# Altium schematic sheet 3MotorDrivers.SchDoc
size A4; SheetNumber: 1; SheetTotal: 1
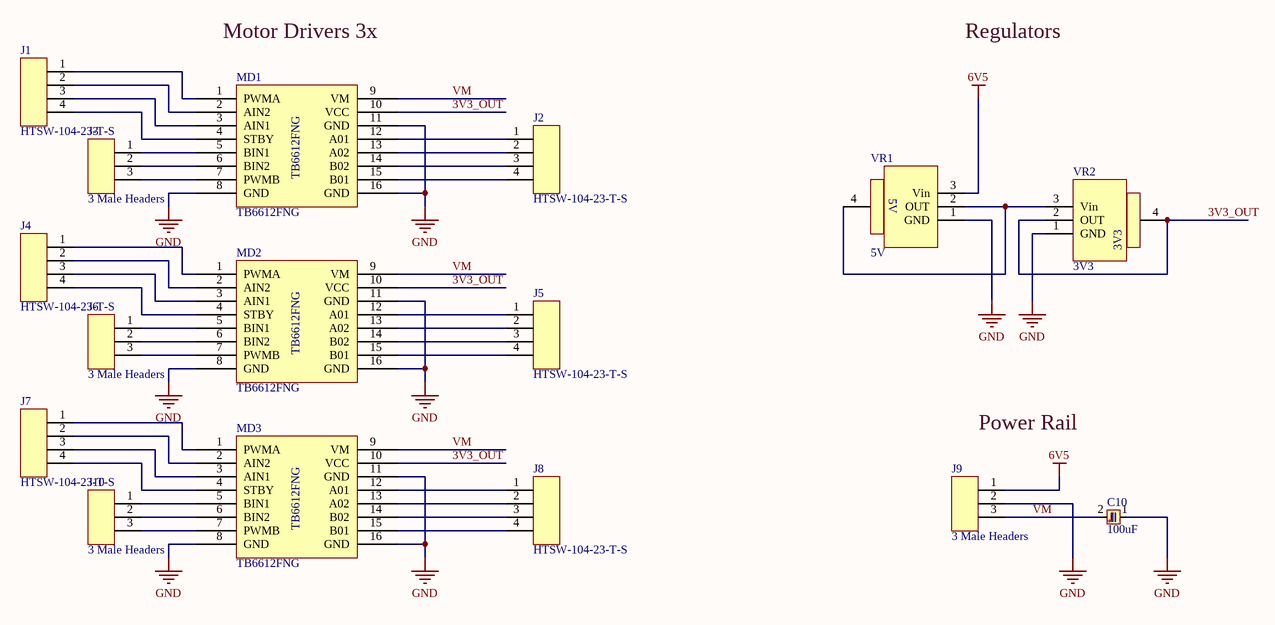
[diagram p0: 3MotorDrivers.SchDoc]

## Parts
C10  100uF  [47nF]
J1  HTSW-104-23-T-S  [4 POS]
J2  HTSW-104-23-T-S  [4 POS]
J3  3 Male Headers  [3 POS]
J4  HTSW-104-23-T-S  [4 POS]
J5  HTSW-104-23-T-S  [4 POS]
J6  3 Male Headers  [3 POS]
J7  HTSW-104-23-T-S  [4 POS]
J8  HTSW-104-23-T-S  [4 POS]
J9  3 Male Headers  [3 POS]
J10  3 Male Headers  [3 POS]
MD1  TB6612FNG  [TB6612FNG]
MD2  TB6612FNG  [TB6612FNG]
MD3  TB6612FNG  [TB6612FNG]
VR1  5V  [3V3]
VR2  3V3  [3V3]

## Nets
6V5: J9.1(SIG) VR1.3(Vin)
GND: C10.1 J9.2(VCC) MD1.8(GND) MD1.11(GND) MD1.16(GND) MD2.8(GND) MD2.11(GND) MD2.16(GND) MD3.8(GND) MD3.11(GND) MD3.16(GND) VR1.1(GND) VR2.1(GND)
3V3_OUT: MD1.10(VCC) MD2.10(VCC) MD3.10(VCC) VR2.2(OUT) VR2.4(OUT)
VM: C10.2 J9.3(GND) MD1.9(VM) MD2.9(VM) MD3.9(VM)
NetJ1_1: J1.1(VM) MD1.1(PWMA)
NetJ1_2: J1.2(GND) MD1.2(AIN2)
NetJ1_3: J1.3(SCL) MD1.3(AIN1)
NetJ1_4: J1.4(SDA) MD1.4(STBY)
NetJ2_1: J2.1(VM) MD1.12(A01)
NetJ2_2: J2.2(GND) MD1.13(A02)
NetJ2_3: J2.3(SCL) MD1.14(B02)
NetJ2_4: J2.4(SDA) MD1.15(B01)
NetJ3_1: J3.1(SIG) MD1.5(BIN1)
NetJ3_2: J3.2(VCC) MD1.6(BIN2)
NetJ3_3: J3.3(GND) MD1.7(PWMB)
NetJ4_1: J4.1(VM) MD2.1(PWMA)
NetJ4_2: J4.2(GND) MD2.2(AIN2)
NetJ4_3: J4.3(SCL) MD2.3(AIN1)
NetJ4_4: J4.4(SDA) MD2.4(STBY)
NetJ5_1: J5.1(VM) MD2.12(A01)
NetJ5_2: J5.2(GND) MD2.13(A02)
NetJ5_3: J5.3(SCL) MD2.14(B02)
NetJ5_4: J5.4(SDA) MD2.15(B01)
NetJ6_1: J6.1(SIG) MD2.5(BIN1)
NetJ6_2: J6.2(VCC) MD2.6(BIN2)
NetJ6_3: J6.3(GND) MD2.7(PWMB)
NetJ7_1: J7.1(VM) MD3.1(PWMA)
NetJ7_2: J7.2(GND) MD3.2(AIN2)
NetJ7_3: J7.3(SCL) MD3.3(AIN1)
NetJ7_4: J7.4(SDA) MD3.4(STBY)
NetJ8_1: J8.1(VM) MD3.12(A01)
NetJ8_2: J8.2(GND) MD3.13(A02)
NetJ8_3: J8.3(SCL) MD3.14(B02)
NetJ8_4: J8.4(SDA) MD3.15(B01)
NetJ10_1: J10.1(SIG) MD3.5(BIN1)
NetJ10_2: J10.2(VCC) MD3.6(BIN2)
NetJ10_3: J10.3(GND) MD3.7(PWMB)
NetVR1_2: VR1.2(OUT) VR1.4(OUT) VR2.3(Vin)

## Notes on the sheet
- Motor Drivers 3x
- Regulators
- Power Rail

## Library data of the parts
C10 = 100uF: Pin Header, Board-to-Board, Wire-to-Board, 2.54 mm, 1 Rows, 2 Contacts, Through Hole, HTSW Series; Manufacturer: Samtec; Manufacturer Part Number: HTSW-102-16-T-S; Manufacturer Lifecycle Status: PRODUCTION; Gender: Male; Number of Contacts: 2; Pitch: 2.54mm; Supplier: Avnet; Supplier Part Number: HTSW-102-16-T-S; RoHS: Compliant; Category: Board to Board Connectors; Stock: 2347; Pricing: 1=0.1485, 1000=0.06895, 5000=0.0494, 10000=0.0491, 20000=0.04881 (USD); Contact Material: Bronze; Contact Plating: Tin; Lead Pitch: 2.54mm; Lifecycle Status: Production; Mounting Technology: Through Hole; Number of Rows: 1; Packaging: Bulk; Radiation Hardening: No; REACH SVHC: No; Termination: Solder; ComponentLink1URL: https://datasheet.octopart.com:443/HTSW-102-16-T-S-Samtec-datasheet-97084101.pdf?src-supplier=Samtec; ComponentLink1Description: https://datasheet.octopart.com:443/HTSW-102-16-T-S-Samtec-datasheet-97084101.pdf?src-supplier=Samtec; ComponentLink2URL: https://sigma.octopart.com:443/14433675/technical_drawing/Samtec-HTSW-102-16-T-S.pdf?src-supplier=Samtec; ComponentLink2Description: https://sigma.octopart.com:443/14433675/technical_drawing/Samtec-HTSW-102-16-T-S.pdf?src-supplier=Samtec; ComponentLink3URL: https://datasheet.octopart.com:443/HTSW-102-16-T-S-Samtec-datasheet-150856372.pdf?src-supplier=Sager+Electronics; ComponentLink3Description: https://datasheet.octopart.com:443/HTSW-102-16-T-S-Samtec-datasheet-150856372.pdf?src-supplier=Sager+Electronics; ComponentLink4URL: https://datasheet.octopart.com:443/HTSW-102-16-T-S-Samtec-datasheet-151455181.pdf?src-supplier=Sager+Electronics; ComponentLink4Description: https://datasheet.octopart.com:443/HTSW-102-16-T-S-Samtec-datasheet-151455181.pdf?src-supplier=Sager+Electronics; ComponentLink5URL: https://datasheet.octopart.com:443/HTSW-102-16-T-S-Samtec-datasheet-136646178.pdf?src-supplier=Electro+Sonic; ComponentLink5Description: https://datasheet.octopart.com:443/HTSW-102-16-T-S-Samtec-datasheet-136646178.pdf?src-supplier=Electro+Sonic; ComponentLink6URL: https://datasheet.octopart.com:443/HTSW-102-16-T-S-Samtec-datasheet-62107121.pdf?src-supplier=Farnell; ComponentLink6Description: https://datasheet.octopart.com:443/HTSW-102-16-T-S-Samtec-datasheet-62107121.pdf?src-supplier=Farnell; ComponentLink7URL: https://datasheet.octopart.com:443/HTSW-102-16-T-S-Samtec-datasheet-180249195.pdf?src-supplier=JRH+Electronics; ComponentLink7Description: https://datasheet.octopart.com:443/HTSW-102-16-T-S-Samtec-datasheet-180249195.pdf?src-supplier=JRH+Electronics; ComponentLink8URL: https://datasheet.octopart.com/HTSW-102-16-T-S-Samtec-datasheet-86818365.pdf; ComponentLink8Description: https://datasheet.octopart.com/HTSW-102-16-T-S-Samtec-datasheet-86818365.pdf; ComponentLink9URL: https://datasheet.octopart.com:443/HTSW-102-16-T-S-Samtec-datasheet-21214457.pdf?src-supplier=Newark; ComponentLink9Description: https://datasheet.octopart.com:443/HTSW-102-16-T-S-Samtec-datasheet-21214457.pdf?src-supplier=Newark
J1 J2 J4 J5 J7 J8 = 4 POS: 4POS CONN HEADER VERT  2.54MM; Manufacturer: Samtec; Manufacturer Lifecycle Status: PRODUCTION; Gender: Male; Number of Contacts: 4; Supplier: DigiKey; Supplier Part Number: 612-HTSW-104-23-T-S-ND; Manufacturer Part Number: HTSW-104-23-T-S; RoHS: Compliant; Category: Board to Board Connectors; Pricing: 1=0.33 (USD); Contact Material: Bronze; Contact Plating: Tin; Lead Pitch: 2.54mm; Lifecycle Status: Production; Mounting Technology: Through Hole; Number of Rows: 1; Packaging: Bulk; Pitch: 2.54mm; Radiation Hardening: No; REACH SVHC: No; Termination: Solder; ComponentLink1URL: https://datasheet.octopart.com:443/HTSW-104-23-T-S-Samtec-datasheet-97084101.pdf?src-supplier=Samtec; ComponentLink1Description: https://datasheet.octopart.com:443/HTSW-104-23-T-S-Samtec-datasheet-97084101.pdf?src-supplier=Samtec; ComponentLink2URL: https://sigma.octopart.com:443/14433675/technical_drawing/Samtec-HTSW-104-23-T-S.pdf?src-supplier=Samtec; ComponentLink2Description: https://sigma.octopart.com:443/14433675/technical_drawing/Samtec-HTSW-104-23-T-S.pdf?src-supplier=Samtec; ComponentLink3URL: https://datasheet.octopart.com:443/HTSW-104-23-T-S-Samtec-datasheet-136646178.pdf?src-supplier=Electro+Sonic; ComponentLink3Description: https://datasheet.octopart.com:443/HTSW-104-23-T-S-Samtec-datasheet-136646178.pdf?src-supplier=Electro+Sonic; ComponentLink4URL: https://datasheet.octopart.com:443/HTSW-104-23-T-S-Samtec-datasheet-150856372.pdf?src-supplier=Electro+Sonic; ComponentLink4Description: https://datasheet.octopart.com:443/HTSW-104-23-T-S-Samtec-datasheet-150856372.pdf?src-supplier=Electro+Sonic; ComponentLink5URL: https://datasheet.octopart.com:443/HTSW-104-23-T-S-Samtec-datasheet-62107121.pdf?src-supplier=Farnell; ComponentLink5Description: https://datasheet.octopart.com:443/HTSW-104-23-T-S-Samtec-datasheet-62107121.pdf?src-supplier=Farnell; ComponentLink6URL: https://datasheet.octopart.com:443/HTSW-104-23-T-S-Samtec-datasheet-180249195.pdf?src-supplier=JRH+Electronics; ComponentLink6Description: https://datasheet.octopart.com:443/HTSW-104-23-T-S-Samtec-datasheet-180249195.pdf?src-supplier=JRH+Electronics; ComponentLink7URL: https://datasheet.octopart.com:443/HTSW-104-23-T-S-Samtec-datasheet-151455181.pdf?src-supplier=Sager+Electronics; ComponentLink7Description: https://datasheet.octopart.com:443/HTSW-104-23-T-S-Samtec-datasheet-151455181.pdf?src-supplier=Sager+Electronics; ComponentLink8URL: https://datasheet.octopart.com/HTSW-104-23-T-S-Samtec-datasheet-86818365.pdf; ComponentLink8Description: https://datasheet.octopart.com/HTSW-104-23-T-S-Samtec-datasheet-86818365.pdf; ComponentLink9URL: https://datasheet.octopart.com:443/HTSW-104-23-T-S-Samtec-datasheet-21214457.pdf?src-supplier=Newark; ComponentLink9Description: https://datasheet.octopart.com:443/HTSW-104-23-T-S-Samtec-datasheet-21214457.pdf?src-supplier=Newark
J3 J6 J9 J10 = 3 POS: CONN HEADER VERT 3POS 1.27MM; Manufacturer: Samtec; Manufacturer Part Number: FTS-103-01-L-S; Manufacturer Lifecycle Status: PRODUCTION; Number of Contacts: 3; Supplier: DigiKey; Supplier Part Number: SAM15177-ND; RoHS: Compliant; Category: Headers and Wire Housings; Stock: 1795; Pricing: 1=0.85, 50=0.7444, 100=0.6307, 500=0.5244, 1000=0.4479, 2000=0.36622, 5000=0.34448 (USD); Contact Plating: Gold; Gender: Male; Lifecycle Status: Production; Mounting Technology: Through Hole; Number of Rows: 1; Packaging: Bulk; Pitch: 1.27mm; Radiation Hardening: No; Termination: Solder; ComponentLink1URL: https://datasheet.octopart.com:443/FTS-103-01-L-S-Samtec-datasheet-97029283.pdf?src-supplier=Newark; ComponentLink1Description: https://datasheet.octopart.com:443/FTS-103-01-L-S-Samtec-datasheet-97029283.pdf?src-supplier=Newark; ComponentLink2URL: https://sigma.octopart.com:443/97029285/technical_drawing/Samtec-FTS-103-01-L-S.pdf?src-supplier=Newark; ComponentLink2Description: https://sigma.octopart.com:443/97029285/technical_drawing/Samtec-FTS-103-01-L-S.pdf?src-supplier=Newark; ComponentLink3URL: https://datasheet.octopart.com:443/FTS-103-01-L-S-Samtec-datasheet-118493358.pdf?src-supplier=Electro+Sonic; ComponentLink3Description: https://datasheet.octopart.com:443/FTS-103-01-L-S-Samtec-datasheet-118493358.pdf?src-supplier=Electro+Sonic; ComponentLink4URL: https://datasheet.octopart.com:443/FTS-103-01-L-S-Samtec-datasheet-165596534.pdf?src-supplier=JRH+Electronics; ComponentLink4Description: https://datasheet.octopart.com:443/FTS-103-01-L-S-Samtec-datasheet-165596534.pdf?src-supplier=JRH+Electronics; ComponentLink5URL: https://datasheet.octopart.com:443/FTS-103-01-L-S-Samtec-datasheet-176663378.pdf?src-supplier=Toby+Electronics; ComponentLink5Description: https://datasheet.octopart.com:443/FTS-103-01-L-S-Samtec-datasheet-176663378.pdf?src-supplier=Toby+Electronics; ComponentLink6URL: https://datasheet.octopart.com:443/FTS-103-01-L-S-Samtec-datasheet-116535195.pdf?src-supplier=Toby+Electronics; ComponentLink6Description: https://datasheet.octopart.com:443/FTS-103-01-L-S-Samtec-datasheet-116535195.pdf?src-supplier=Toby+Electronics; ComponentLink7URL: https://datasheet.octopart.com:443/FTS-103-01-L-S-Samtec-datasheet-136395376.pdf?src-supplier=Toby+Electronics; ComponentLink7Description: https://datasheet.octopart.com:443/FTS-103-01-L-S-Samtec-datasheet-136395376.pdf?src-supplier=Toby+Electronics; ComponentLink8URL: https://datasheet.octopart.com:443/FTS-103-01-L-S-Samtec-datasheet-151470456.pdf?src-supplier=Sager+Electronics; ComponentLink8Description: https://datasheet.octopart.com:443/FTS-103-01-L-S-Samtec-datasheet-151470456.pdf?src-supplier=Sager+Electronics; LCSC Part Number: C6253705
MD1-MD3 = TB6612FNG: Strip Terminal Block, 8A, 0.5mm2, 1 Row(s), 1 Deck(s); Manufacturer: Phoenix Contact; Manufacturer Part Number: 1945151; Manufacturer Lifecycle Status: AVAILABLE; Approvals: UL; Contact Resistance: 1.8mΩ; Current: 10A; Max Current Rating: 6A; Number of Contacts: 8; Number of Levels: 1; Pitch: 3.5mm; Voltage: 300V; Voltage Rating: 160V; Wire/Cable Gauge: 20AWG; Supplier: Mouser; Supplier Part Number: 651-1945151; RoHS: Compliant; Category: Terminal Blocks; Stock: 5397; Pricing: 1=0.76, 10=0.76, 50=0.76, 100=0.76, 1000=0.76, 10000=0.76 (USD); China RoHS: Compliant; Color: Black; Contact Plating: Tin; Country of Origin: Germany; Current Rating: 8A; Depth: 2.8mm; Export Control Classification Number (ECCN) Code: EAR99; Flammability Rating: UL94 V-0; Housing Color: Black; Harmonized Tariff Schedule (HTS) Code: 8536.90.40.00; Introduction Date: 2002-11-26; Lead Free: Lead Free; Lifecycle Status: Production; Mounting Technology: Solder; Pins: 8; Number of Positions: 8; Number of Positions Per Level: 8; Number of Rows: 1; Orientation: Straight; Packaging: Bulk; REACH SVHC: Unaffected; Termination: Solder; Weight: 869.990166mg; Width: 24.5mm; ComponentLink1URL: https://datasheet.octopart.com:443/1945151-Phoenix-Contact-datasheet-66579491.pdf?src-supplier=element14+APAC; ComponentLink1Description: https://datasheet.octopart.com:443/1945151-Phoenix-Contact-datasheet-66579491.pdf?src-supplier=element14+APAC; ComponentLink2URL: https://datasheet.octopart.com:443/PST-1.0/8-3.5-Phoenix-Contact-datasheet-8822167.pdf?src-supplier=element14+APAC; ComponentLink2Description: https://datasheet.octopart.com:443/PST-1.0/8-3.5-Phoenix-Contact-datasheet-8822167.pdf?src-supplier=element14+APAC; ComponentLink3URL: https://datasheet.octopart.com:443/1945151-Phoenix-Contact-datasheet-175456693.pdf?src-supplier=Master+Electronics; ComponentLink3Description: https://datasheet.octopart.com:443/1945151-Phoenix-Contact-datasheet-175456693.pdf?src-supplier=Master+Electronics; ComponentLink4URL: https://datasheet.octopart.com:443/1945151-Phoenix-Contact-datasheet-154783991.pdf?src-supplier=Electro+Sonic; ComponentLink4Description: https://datasheet.octopart.com:443/1945151-Phoenix-Contact-datasheet-154783991.pdf?src-supplier=Electro+Sonic; ComponentLink5URL: https://datasheet.octopart.com:443/1945151-Phoenix-Contact-datasheet-33525158.pdf?src-supplier=MRO+Stop; ComponentLink5Description: https://datasheet.octopart.com:443/1945151-Phoenix-Contact-datasheet-33525158.pdf?src-supplier=MRO+Stop; ComponentLink6URL: https://datasheet.octopart.com:443/1945151-Phoenix-Contact-datasheet-164875081.pdf?src-supplier=Burklin+Elektronik; ComponentLink6Description: https://datasheet.octopart.com:443/1945151-Phoenix-Contact-datasheet-164875081.pdf?src-supplier=Burklin+Elektronik; ComponentLink7URL: https://datasheet.octopart.com:443/1945151-Phoenix-Contact-datasheet-54101.pdf?src-supplier=DigiKey; ComponentLink7Description: https://datasheet.octopart.com:443/1945151-Phoenix-Contact-datasheet-54101.pdf?src-supplier=DigiKey; ComponentLink8URL: https://datasheet.octopart.com:443/1945151-Phoenix-Contact-datasheet-94777.pdf?src-supplier=RS+(Formerly+Allied+Electronics); ComponentLink8Description: https://datasheet.octopart.com:443/1945151-Phoenix-Contact-datasheet-94777.pdf?src-supplier=RS+(Formerly+Allied+Electronics); ComponentLink9URL: https://datasheet.octopart.com:443/1945151-Phoenix-Contact-datasheet-62084791.pdf?src-supplier=RS+(Formerly+Allied+Electronics); ComponentLink9Description: https://datasheet.octopart.com:443/1945151-Phoenix-Contact-datasheet-62084791.pdf?src-supplier=RS+(Formerly+Allied+Electronics); ComponentLink10URL: http://sigma.octopart.com:80/195219851/materials_sheet/Phoenix-Contact-1945151.pdf?src-supplier=Compliance+Statements; ComponentLink10Description: http://sigma.octopart.com:80/195219851/materials_sheet/Phoenix-Contact-1945151.pdf?src-supplier=Compliance+Statements
VR1 = 5V: 10mA positive electrode fixed 3.3V 15V 6mV SOT-223 SMD mount 3.71mm(width)*1.8mm(height); Manufacturer: Analog Devices; Manufacturer Part Number: LT1117CST-3.3#PBF; Manufacturer Lifecycle Status: PRODUCTION; Dropout Voltage: 1.1V; Max Output current: 800mA; Min Input Voltage: 2.45V; Number of Channels: 1; Operating Supply Current: 5mA; Output Voltage Accuracy: 1%; Power Supply Rejection Ratio (PSRR): 75dB; Reference Voltage: 1.27V; Supplier: DigiKey; Supplier Part Number: 505-LT1117CST-3.3#PBF-ND; RoHS: Compliant; Category: LDO Voltage Regulators; Stock: 5446; Pricing: 1=7.96, 10=6.16, 78=5.28808, 156=5.09051, 312=4.92788, 546=4.81782, 1014=4.71464 (USD); Case/Package: SOT-223-3; Height: 1.8mm; Lead Free: Lead Free; Length: 6.71mm; Lifecycle Status: Production; Max Supply Voltage: 15V; Max Operating Temperature: 125°C; Min Current Limit: 800mA; Min Operating Temperature: 0°C; Mounting Technology: Surface Mount; Nominal Output Voltage: 3.3V; Number of Outputs: 1; Pins: 3; Number of Regulators: 1; Output Current: 800mA; Output Type: Fixed; Output Voltage: 3.3V; Packaging: Bulk; Polarity: Positive; Quiescent Current: 10mA; Radiation Hardening: No; REACH SVHC: Unaffected; Schedule B: 8542390000, 8542390000|8542390000|8542390000|8542390000|8542390000|8542390000|8542390000|8542390000|8542390000|8542390000|8542390000|8542390000|8542390000|8542390000|8542390000|8542390000|8542390000|8542390000|8542390000|8542390000|8542390000|8542390000|8542390000|85; Width: 3.71mm; ComponentLink1URL: https://datasheet.octopart.com:443/LT1117CST-3.3%23PBF-Analog-Devices-datasheet-10688060.pdf?src-supplier=element14+APAC; ComponentLink1Description: https://datasheet.octopart.com:443/LT1117CST-3.3%23PBF-Analog-Devices-datasheet-10688060.pdf?src-supplier=element14+APAC; ComponentLink2URL: https://octopart.com:443/opatz8j6/c1?t=sxPfvuRhnwazmxrmq8OcozQ_deCTcj93l61TCwHHAMrfHd1zMJUbDN1BQRyopVTPT06EZltW9au6ThzHazGz_K01nYGgQQbAqUW7xZoQbMQj_Tk9mo54BoGqI58goAQNKChcZH57xe3yJR3CLvqjnZIhvnC6ZUnXmbxCUgfO7NVBhd06IAa9UBMTy5__Do4QRO1H7gN19Bt_59SFkSqeidpjLdGkU2gnUhcEunfk7eyIcREwc1Qh4I3mNFWWaQ5DTh2xZX-NMPM0Sc5KZLLtUjKhzoxxlKwGl3cc6mUQ8r87b7CLjsspdA&src-supplier=Analog+Devices; ComponentLink2Description: https://octopart.com:443/opatz8j6/c1?t=sxPfvuRhnwazmxrmq8OcozQ_deCTcj93l61TCwHHAMrfHd1zMJUbDN1BQRyopVTPT06EZltW9au6ThzHazGz_K01nYGgQQbAqUW7xZoQbMQj_Tk9mo54BoGqI58goAQNKChcZH57xe3yJR3CLvqjnZIhvnC6ZUnXmbxCUgfO7NVBhd06IAa9UBMTy5__Do4QRO1H7gN19Bt_59SFkSqeidpjLdGkU2gnUhcEunfk7eyIcREwc1Qh4I3mNFWWaQ5DTh2xZX-NMPM0Sc5KZLLtUjKhzoxxlKwGl3cc6mUQ8r87b7CLjsspdA&src-supplier=Analog+Devices; ComponentLink3URL: https://datasheet.octopart.com:443/LT1117CST-3.3%23PBF-Linear-Technology-datasheet-501865.pdf?src-supplier=element14; ComponentLink3Description: https://datasheet.octopart.com:443/LT1117CST-3.3%23PBF-Linear-Technology-datasheet-501865.pdf?src-supplier=element14; ComponentLink4URL: https://datasheet.octopart.com:443/LT1117CST-3.3%23PBF-Analog-Devices-datasheet-11554267.pdf?src-supplier=SOS+electronic; ComponentLink4Description: https://datasheet.octopart.com:443/LT1117CST-3.3%23PBF-Analog-Devices-datasheet-11554267.pdf?src-supplier=SOS+electronic; ComponentLink5URL: https://sigma.octopart.com:443/57690395/technical_drawing/Linear-Technology-LT1117CST-3.3%23PBF.pdf?src-supplier=Linear+Technology; ComponentLink5Description: https://sigma.octopart.com:443/57690395/technical_drawing/Linear-Technology-LT1117CST-3.3%23PBF.pdf?src-supplier=Linear+Technology; ComponentLink6URL: https://datasheet.octopart.com:443/LT1117CST-3.3%23PBF-Linear-Technology-datasheet-8209746.pdf?src-supplier=Jameco+(USA); ComponentLink6Description: https://datasheet.octopart.com:443/LT1117CST-3.3%23PBF-Linear-Technology-datasheet-8209746.pdf?src-supplier=Jameco+(USA); ComponentLink7URL: http://sigma.octopart.com:80/conflict_mineral_statement/Analog-Devices-company-33.pdf?src-supplier=Compliance+Statements; ComponentLink7Description: http://sigma.octopart.com:80/conflict_mineral_statement/Analog-Devices-company-33.pdf?src-supplier=Compliance+Statements; ComponentLink8URL: https://octopart.com:443/opatz8j6/c1?t=Itd0_Rzn44atCgyqqsaW9vqyNROmcDdOOlmDNuHQy5sG6RlJFqPrF18Q09GdkdA4DnnOnQyFiKa-xTy84isrbvQcKhyHdREctLTuDeXElH90lmN1SFw106Zq8a491SeXECFg075oa3RZHoUhm261CrSHgUqgifs4IJe2bcS4VG6cTp0XbT4a9-5BFrudppU15yqarzS6nzIestfbH4UNq1eEbTliTQbkkowoZRDFvmMPpk22GyonWMwg9GqKAKAtjcwvRjM6GvyXDZLmJkvlZxPaACvllw-u3xX1LKWDQgG40xXiC5YhaA&src-supplier=Compliance+Statements; ComponentLink8Description: https://octopart.com:443/opatz8j6/c1?t=Itd0_Rzn44atCgyqqsaW9vqyNROmcDdOOlmDNuHQy5sG6RlJFqPrF18Q09GdkdA4DnnOnQyFiKa-xTy84isrbvQcKhyHdREctLTuDeXElH90lmN1SFw106Zq8a491SeXECFg075oa3RZHoUhm261CrSHgUqgifs4IJe2bcS4VG6cTp0XbT4a9-5BFrudppU15yqarzS6nzIestfbH4UNq1eEbTliTQbkkowoZRDFvmMPpk22GyonWMwg9GqKAKAtjcwvRjM6GvyXDZLmJkvlZxPaACvllw-u3xX1LKWDQgG40xXiC5YhaA&src-supplier=Compliance+Statements
VR2 = 3V3: 10mA positive electrode fixed 3.3V 15V 6mV SOT-223 SMD mount 3.71mm(width)*1.8mm(height); Manufacturer: Analog Devices; Manufacturer Part Number: LT1117CST-3.3#PBF; Manufacturer Lifecycle Status: PRODUCTION; Dropout Voltage: 1.1V; Max Output current: 800mA; Min Input Voltage: 2.45V; Number of Channels: 1; Operating Supply Current: 5mA; Output Voltage Accuracy: 1%; Power Supply Rejection Ratio (PSRR): 75dB; Reference Voltage: 1.27V; Supplier: DigiKey; Supplier Part Number: 505-LT1117CST-3.3#PBF-ND; RoHS: Compliant; Category: LDO Voltage Regulators; Stock: 5446; Pricing: 1=7.96, 10=6.16, 78=5.28808, 156=5.09051, 312=4.92788, 546=4.81782, 1014=4.71464 (USD); Case/Package: SOT-223-3; Height: 1.8mm; Lead Free: Lead Free; Length: 6.71mm; Lifecycle Status: Production; Max Supply Voltage: 15V; Max Operating Temperature: 125°C; Min Current Limit: 800mA; Min Operating Temperature: 0°C; Mounting Technology: Surface Mount; Nominal Output Voltage: 3.3V; Number of Outputs: 1; Pins: 3; Number of Regulators: 1; Output Current: 800mA; Output Type: Fixed; Output Voltage: 3.3V; Packaging: Bulk; Polarity: Positive; Quiescent Current: 10mA; Radiation Hardening: No; REACH SVHC: Unaffected; Schedule B: 8542390000, 8542390000|8542390000|8542390000|8542390000|8542390000|8542390000|8542390000|8542390000|8542390000|8542390000|8542390000|8542390000|8542390000|8542390000|8542390000|8542390000|8542390000|8542390000|8542390000|8542390000|8542390000|8542390000|8542390000|85; Width: 3.71mm; ComponentLink1URL: https://datasheet.octopart.com:443/LT1117CST-3.3%23PBF-Analog-Devices-datasheet-10688060.pdf?src-supplier=element14+APAC; ComponentLink1Description: https://datasheet.octopart.com:443/LT1117CST-3.3%23PBF-Analog-Devices-datasheet-10688060.pdf?src-supplier=element14+APAC; ComponentLink2URL: https://octopart.com:443/opatz8j6/c1?t=sxPfvuRhnwazmxrmq8OcozQ_deCTcj93l61TCwHHAMrfHd1zMJUbDN1BQRyopVTPT06EZltW9au6ThzHazGz_K01nYGgQQbAqUW7xZoQbMQj_Tk9mo54BoGqI58goAQNKChcZH57xe3yJR3CLvqjnZIhvnC6ZUnXmbxCUgfO7NVBhd06IAa9UBMTy5__Do4QRO1H7gN19Bt_59SFkSqeidpjLdGkU2gnUhcEunfk7eyIcREwc1Qh4I3mNFWWaQ5DTh2xZX-NMPM0Sc5KZLLtUjKhzoxxlKwGl3cc6mUQ8r87b7CLjsspdA&src-supplier=Analog+Devices; ComponentLink2Description: https://octopart.com:443/opatz8j6/c1?t=sxPfvuRhnwazmxrmq8OcozQ_deCTcj93l61TCwHHAMrfHd1zMJUbDN1BQRyopVTPT06EZltW9au6ThzHazGz_K01nYGgQQbAqUW7xZoQbMQj_Tk9mo54BoGqI58goAQNKChcZH57xe3yJR3CLvqjnZIhvnC6ZUnXmbxCUgfO7NVBhd06IAa9UBMTy5__Do4QRO1H7gN19Bt_59SFkSqeidpjLdGkU2gnUhcEunfk7eyIcREwc1Qh4I3mNFWWaQ5DTh2xZX-NMPM0Sc5KZLLtUjKhzoxxlKwGl3cc6mUQ8r87b7CLjsspdA&src-supplier=Analog+Devices; ComponentLink3URL: https://datasheet.octopart.com:443/LT1117CST-3.3%23PBF-Linear-Technology-datasheet-501865.pdf?src-supplier=element14; ComponentLink3Description: https://datasheet.octopart.com:443/LT1117CST-3.3%23PBF-Linear-Technology-datasheet-501865.pdf?src-supplier=element14; ComponentLink4URL: https://datasheet.octopart.com:443/LT1117CST-3.3%23PBF-Analog-Devices-datasheet-11554267.pdf?src-supplier=SOS+electronic; ComponentLink4Description: https://datasheet.octopart.com:443/LT1117CST-3.3%23PBF-Analog-Devices-datasheet-11554267.pdf?src-supplier=SOS+electronic; ComponentLink5URL: https://sigma.octopart.com:443/57690395/technical_drawing/Linear-Technology-LT1117CST-3.3%23PBF.pdf?src-supplier=Linear+Technology; ComponentLink5Description: https://sigma.octopart.com:443/57690395/technical_drawing/Linear-Technology-LT1117CST-3.3%23PBF.pdf?src-supplier=Linear+Technology; ComponentLink6URL: https://datasheet.octopart.com:443/LT1117CST-3.3%23PBF-Linear-Technology-datasheet-8209746.pdf?src-supplier=Jameco+(USA); ComponentLink6Description: https://datasheet.octopart.com:443/LT1117CST-3.3%23PBF-Linear-Technology-datasheet-8209746.pdf?src-supplier=Jameco+(USA); ComponentLink7URL: http://sigma.octopart.com:80/conflict_mineral_statement/Analog-Devices-company-33.pdf?src-supplier=Compliance+Statements; ComponentLink7Description: http://sigma.octopart.com:80/conflict_mineral_statement/Analog-Devices-company-33.pdf?src-supplier=Compliance+Statements; ComponentLink8URL: https://octopart.com:443/opatz8j6/c1?t=Itd0_Rzn44atCgyqqsaW9vqyNROmcDdOOlmDNuHQy5sG6RlJFqPrF18Q09GdkdA4DnnOnQyFiKa-xTy84isrbvQcKhyHdREctLTuDeXElH90lmN1SFw106Zq8a491SeXECFg075oa3RZHoUhm261CrSHgUqgifs4IJe2bcS4VG6cTp0XbT4a9-5BFrudppU15yqarzS6nzIestfbH4UNq1eEbTliTQbkkowoZRDFvmMPpk22GyonWMwg9GqKAKAtjcwvRjM6GvyXDZLmJkvlZxPaACvllw-u3xX1LKWDQgG40xXiC5YhaA&src-supplier=Compliance+Statements; ComponentLink8Description: https://octopart.com:443/opatz8j6/c1?t=Itd0_Rzn44atCgyqqsaW9vqyNROmcDdOOlmDNuHQy5sG6RlJFqPrF18Q09GdkdA4DnnOnQyFiKa-xTy84isrbvQcKhyHdREctLTuDeXElH90lmN1SFw106Zq8a491SeXECFg075oa3RZHoUhm261CrSHgUqgifs4IJe2bcS4VG6cTp0XbT4a9-5BFrudppU15yqarzS6nzIestfbH4UNq1eEbTliTQbkkowoZRDFvmMPpk22GyonWMwg9GqKAKAtjcwvRjM6GvyXDZLmJkvlZxPaACvllw-u3xX1LKWDQgG40xXiC5YhaA&src-supplier=Compliance+Statements